# Altium project PI5_Robo_Board.PrjPcb
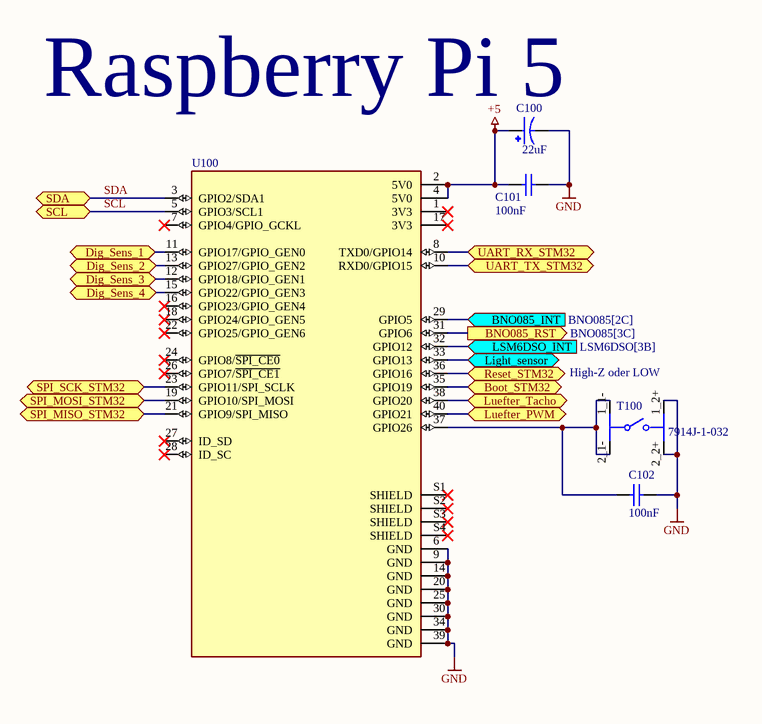
[diagram p0: Raspberry_PI5.SchDoc]
9 sheets, 219 parts. Net scope: flat (ports and power ports of the same name join across sheets).
Board file: PI5_Robo_Board_PCB.PcbDoc
Sheets:
  Raspberry_PI5.SchDoc
  BNO085.SchDoc
  LSM6DSO.SchDoc
  PCA9685.SchDoc
  DRV+Motor.SchDoc
  5V,_3V3,_6a,_Batt.SchDoc
  6b,_6c.SchDoc
  STM32.SchDoc
  Test_Sensor_Connectoren.SchDoc

## Sheet Raspberry_PI5.SchDoc
size A4; SheetNumber: 1; SheetTotal: 9

### Parts
C100  value 22uF  [CAP_EEEFN1A220R]  (hidden comment: ELKO)
C101  value 100nF  [0603]  (hidden comment: 0603)
C102  value 100nF  [0603]  (hidden comment: 0603)
T100  7914J-1-032  [FP-7914J-1-032-MFG]
U100  Raspberry Pi 5  [MODULE_SC0195(9)]  (value not drawn)

### Ports
BNO085_INT (in, see BNO085[2C]), BNO085_RST (out, see BNO085[3C]), Boot_STM32 (bidir, see STM32[2C]), Dig_Sens_1 (bidir, see Test_Sensor_Connectoren[1A]), Dig_Sens_2 (bidir, see Test_Sensor_Connectoren[1A]), Dig_Sens_3 (bidir, see Test_Sensor_Connectoren[1B]), Dig_Sens_4 (bidir, see Test_Sensor_Connectoren[1B]), Light_sensor (bidir, see Test_Sensor_Connectoren[1C]), LSM6DSO_INT (in, see LSM6DSO[3B]), Luefter_PWM (bidir, see Test_Sensor_Connectoren[2C]), Luefter_Tacho (bidir, see Test_Sensor_Connectoren[2C]), Reset_STM32 (bidir, see STM32[2C]), SCL (bidir, see BNO085[2C], LSM6DSO[2B], PCA9685[2B], Test_Sensor_Connectoren[1D], Test_Sensor_Connectoren[2D]), SDA (bidir, see BNO085[2C], LSM6DSO[2B], PCA9685[2B], Test_Sensor_Connectoren[1C], Test_Sensor_Connectoren[2D]), SPI_MISO_STM32 (bidir, see STM32[2B]), SPI_MOSI_STM32 (bidir, see STM32[2B]), SPI_SCK_STM32 (bidir, see STM32[1C]), UART_RX_STM32 (bidir, see STM32[1C]), UART_TX_STM32 (bidir, see STM32[1C])

### Nets
+5: C100.1 C101.2 U100.2(5V0) U100.4(5V0)
GND: C100.2 C101.1 C102.2 T100.1_2+(1_2+) T100.2_2+(2_2+) U100.6(GND) U100.9(GND) U100.14(GND) U100.20(GND) U100.25(GND) U100.30(GND) U100.34(GND) U100.39(GND)
SCL: U100.5(GPIO3/SCL1) ; port SCL
SDA: U100.3(GPIO2/SDA1) ; port SDA
NetC102_1: C102.1 T100.1_1-(1_1-) T100.2_1-(2_1-) U100.37(GPIO26)
NetDIG_Sens_1_2: U100.11(GPIO17/GPIO_GEN0) ; port Dig_Sens_1
NetDIG_Sens_2_2: U100.13(GPIO27/GPIO_GEN2) ; port Dig_Sens_2
NetDIG_Sens_3_2: U100.12(GPIO18/GPIO_GEN1) ; port Dig_Sens_3
NetDIG_Sens_4_2: U100.15(GPIO22/GPIO_GEN3) ; port Dig_Sens_4
NetLight_Sensor_2: U100.33(GPIO13) ; port Light_sensor
NetLuefter_2: U100.38(GPIO20) ; port Luefter_Tacho
NetLuefter_3: U100.40(GPIO21) ; port Luefter_PWM
NetR800_1: U100.36(GPIO16) ; port Reset_STM32
NetU100_8: U100.8(TXD0/GPIO14) ; port UART_RX_STM32
NetU100_10: U100.10(RXD0/GPIO15) ; port UART_TX_STM32
NetU100_19: U100.19(GPIO10/SPI_MOSI) ; port SPI_MOSI_STM32
NetU100_21: U100.21(GPIO9/SPI_MISO) ; port SPI_MISO_STM32
NetU100_23: U100.23(GPIO11/SPI_SCLK) ; port SPI_SCK_STM32
NetU100_29: U100.29(GPIO5) ; port BNO085_INT
NetU100_31: U100.31(GPIO6) ; port BNO085_RST
NetU100_32: U100.32(GPIO12) ; port LSM6DSO_INT
NetU100_35: U100.35(GPIO19) ; port Boot_STM32

Not connected (* = marked no-connect by the designer): U100 1(3V3)* 7(GPIO4/GPIO_GCKL)* 16(GPIO23/GPIO_GEN4)* 17(3V3)* 18(GPIO24/GPIO_GEN5)* 22(GPIO25/GPIO_GEN6)* 24(GPIO8/~{SPI_CE0})* 26(GPIO7/~{SPI_CE1})* 27(ID_SD)* 28(ID_SC)* S1(SHIELD)* S2(SHIELD)* S3(SHIELD)* S4(SHIELD)*

### Notes on the sheet
- (near C100) Raspberry Pi 5
- (near T100) High-Z oder LOW

### Library data of the parts
C100 = EEEFN1A220R: CAP ALUM 22UF 20% 10V SMD; MF: Panasonic; SnapEDA_Link: https://www.snapeda.com/parts/EEEFN1A220R/Panasonic/view-part/?ref=snap; Availability: In Stock; Purchase-URL: https://pricing.snapeda.com/search/part/EEEFN1A220R/?ref=eda; MP: EEEFN1A220R; Price: None; Package: RADIAL-2 Panasonic; Check_prices: https://www.snapeda.com/parts/EEEFN1A220R/Panasonic/view-part/?ref=eda
C101 C102 = KO: Kondensator
T100 = CMP-07427-000007-1: SWITCH TACTILE SPST-NO 0.1A 16V; Mechanical Life: 100000Cycles; Switch Function: Off-Mom; Actuator Material: Rubber; Illumination Type: Non-Illuminated; Actuator Type: Standard; Operating Force: 300gf; Throw Configuration: SPST; Current Rating: 100mA; Contact Plating: Silver; Min Operating Temperature: -55°C; Series: 7914; Package Quantity: 50; Max Operating Temperature: 125°C; Depth: 5mm; Termination: J-Hook; Mount: Surface Mount; RoHS Compliant: Yes; Case/Package: SMD/SMT; Voltage Rating (DC): 16V; Orientation: Straight; Max Current Rating: 100mA; Packaging: Rail/Tube; Length: 5mm; Contact Material: Gold
U100 = SC0195(9): The Raspberry Pi 5 Model B; SnapEDA_Link: https://www.snapeda.com/parts/SC0195(9)/Raspberry+Pi/view-part/?ref=snap; Package: None; Value: *; MF: Raspberry Pi; MP: SC0195(9); Check_prices: https://www.snapeda.com/parts/SC0195(9)/Raspberry+Pi/view-part/?ref=eda

## Sheet BNO085.SchDoc
size A4; SheetNumber: 2; SheetTotal: 9
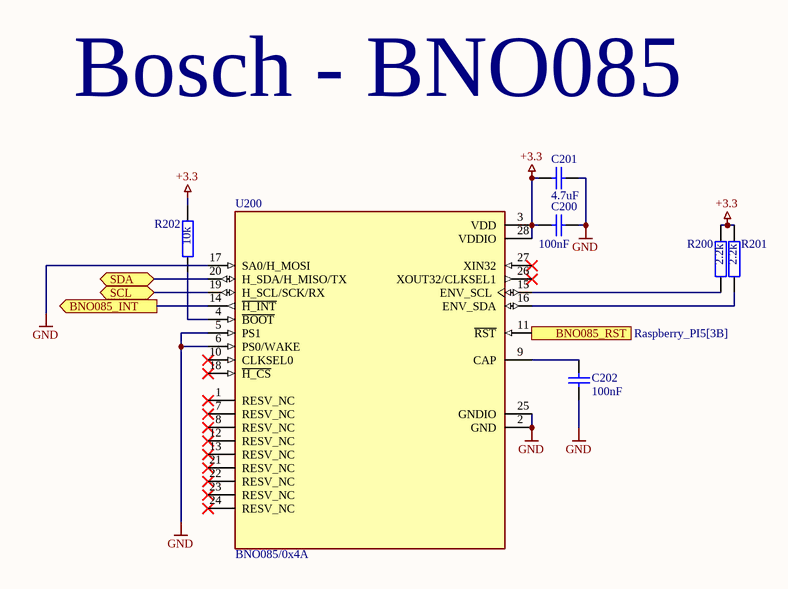
[diagram p1: BNO085.SchDoc]

### Parts
C200  value 100nF  [0603]  (hidden comment: 0603)
C201  value 4.7uF  [0603]  (hidden comment: 0603)
C202  value 100nF  [0603]  (hidden comment: 0603)
R200  value 2.2k  [0603]  (hidden comment: 0603)
R201  value 2.2k  [0603]  (hidden comment: 0603)
R202  value 10k  [0603]  (hidden comment: 0603)
U200  BNO085/0x4A  [IC_BNO085]

### Ports
BNO085_INT (out, see Raspberry_PI5[3B]), BNO085_RST (in, see Raspberry_PI5[3B]), SCL (bidir, see LSM6DSO[2B], PCA9685[2B], Raspberry_PI5[2B], Test_Sensor_Connectoren[1D], Test_Sensor_Connectoren[2D]), SDA (bidir, see LSM6DSO[2B], PCA9685[2B], Raspberry_PI5[2B], Test_Sensor_Connectoren[1C], Test_Sensor_Connectoren[2D])

### Nets
+3.3: C200.1 C201.1 R200.2 R201.2 R202.2 U200.3(VDD) U200.28(VDDIO)
GND: C200.2 C201.2 C202.2 U200.2(GND) U200.5(PS1) U200.6(PS0/WAKE) U200.17(SA0/H_MOSI) U200.25(GNDIO)
SCL: U200.19(H_SCL/SCK/RX) ; port SCL
SDA: U200.20(H_SDA/H_MISO/TX) ; port SDA
NetC202_1: C202.1 U200.9(CAP)
NetR200_1: R200.1 U200.15(ENV_SCL)
NetR201_1: R201.1 U200.16(ENV_SDA)
NetR202_1: R202.1 U200.4(~{BOOT})
NetU100_29: U200.14(~{H_INT}) ; port BNO085_INT
NetU100_31: U200.11(~{RST}) ; port BNO085_RST

Not connected (* = marked no-connect by the designer): U200 1(RESV_NC)* 7(RESV_NC)* 8(RESV_NC)* 10(CLKSEL0)* 12(RESV_NC)* 13(RESV_NC)* 18(~{H_CS})* 21(RESV_NC)* 22(RESV_NC)* 23(RESV_NC)* 24(RESV_NC)* 26(XOUT32/CLKSEL1)* 27(XIN32)*

### Notes on the sheet
- Bosch - BNO085

### Library data of the parts
C200-C202 = KO: Kondensator
R200-R202 = RES: Widerstand
U200 = BNO085: Accelerometer, Gyroscope, Magnetometer, 9 Axis Sensor IÂ²C, SPI, UART Output; MF: Hillcrest Laboratories,; SnapEDA_Link: https://www.snapeda.com/parts/BNO085/Hillcrest+Laboratories%252C+Inc./view-part/?ref=snap; Package: TFLGA-28 Hillcrest Laboratories; Value: *; MP: BNO085; Check_prices: https://www.snapeda.com/parts/BNO085/Hillcrest+Laboratories%252C+Inc./view-part/?ref=eda

## Sheet LSM6DSO.SchDoc
size A4; SheetNumber: 3; SheetTotal: 9
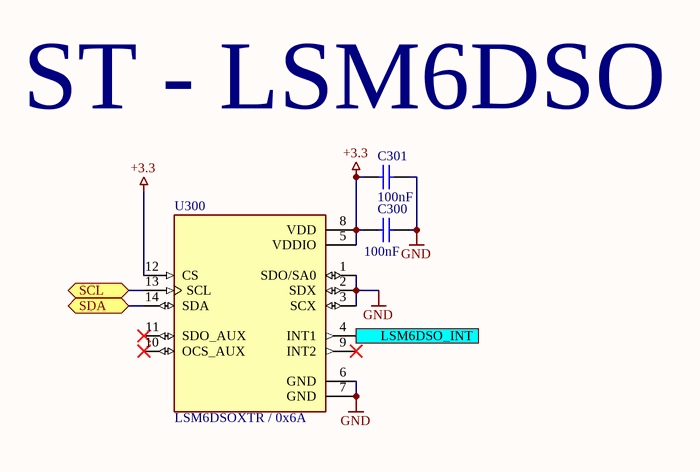
[diagram p2: LSM6DSO.SchDoc]

### Parts
C300  value 100nF  [0603]  (hidden comment: 0603)
C301  value 100nF  [0603]  (hidden comment: 0603)
U300  LSM6DSOXTR / 0x6A  [PQFN50P250X300X86-14N]

### Ports
LSM6DSO_INT (out, see Raspberry_PI5[3B]), SCL (bidir, see BNO085[2C], PCA9685[2B], Raspberry_PI5[2B], Test_Sensor_Connectoren[1D], Test_Sensor_Connectoren[2D]), SDA (bidir, see BNO085[2C], PCA9685[2B], Raspberry_PI5[2B], Test_Sensor_Connectoren[1C], Test_Sensor_Connectoren[2D])

### Nets
+3.3: C300.1 C301.1 U300.5(VDDIO) U300.8(VDD) U300.12(CS)
GND: C300.2 C301.2 U300.1(SDO/SA0) U300.2(SDX) U300.3(SCX) U300.6(GND) U300.7(GND)
SCL: U300.13(SCL) ; port SCL
SDA: U300.14(SDA) ; port SDA
NetU100_32: U300.4(INT1) ; port LSM6DSO_INT

Not connected (* = marked no-connect by the designer): U300 9(INT2)* 10(OCS_AUX)* 11(SDO_AUX)*

### Notes on the sheet
- (near C301) ST - LSM6DSO

### Library data of the parts
C300 C301 = KO: Kondensator
U300 = LSM6DSOXTR: Accelerometer, Gyroscope, 6 Axis Sensor I2C, SPI Output; MF: STMicroelectronics; SnapEDA_Link: https://www.snapeda.com/parts/LSM6DSOXTR/STMicroelectronics/view-part/?ref=snap; Package: VFLGA-14 STMicroelectronics; Value: *; MP: LSM6DSOXTR; Check_prices: https://www.snapeda.com/parts/LSM6DSOXTR/STMicroelectronics/view-part/?ref=eda

## Sheet PCA9685.SchDoc
size A4; SheetNumber: 4; SheetTotal: 9
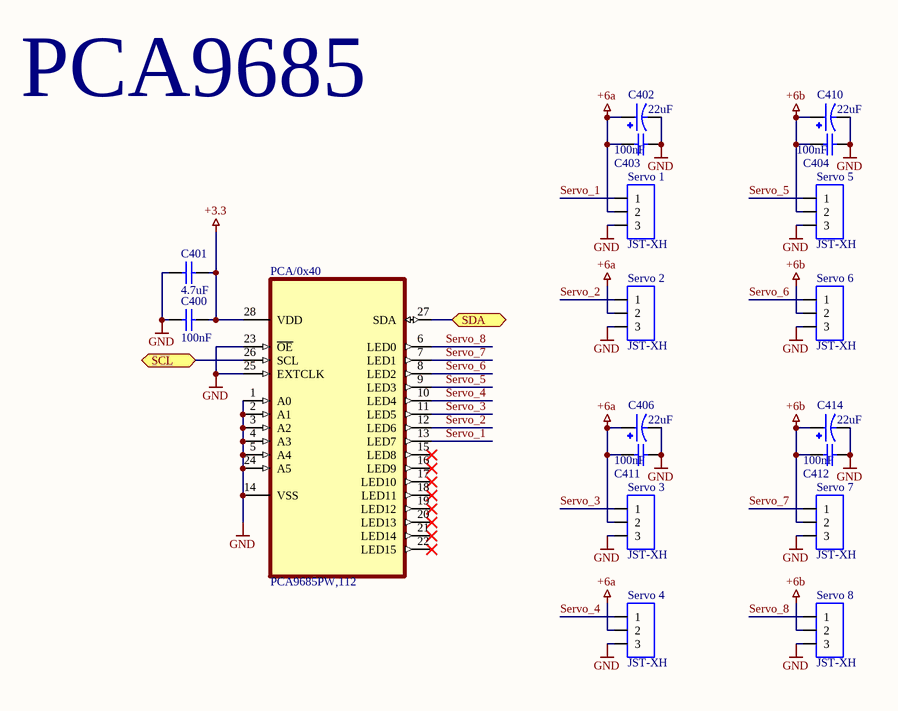
[diagram p3: PCA9685.SchDoc]

### Parts
C400  value 100nF  [0603]  (hidden comment: 0603)
C401  value 4.7uF  [0603]  (hidden comment: 0603)
C402  value 22uF  [CAP_EEEFN1A220R]  (hidden comment: ELKO)
C403  value 100nF  [0603]  (hidden comment: 0603)
C404  value 100nF  [0603]  (hidden comment: 0603)
C406  value 22uF  [CAP_EEEFN1A220R]  (hidden comment: ELKO)
C410  value 22uF  [CAP_EEEFN1A220R]  (hidden comment: ELKO)
C411  value 100nF  [0603]  (hidden comment: 0603)
C412  value 100nF  [0603]  (hidden comment: 0603)
C414  value 22uF  [CAP_EEEFN1A220R]  (hidden comment: ELKO)
PCA/0x40  PCA9685PW,112  [SOP65P640X110-28N]
Servo_1  JST-XH  [Sip-3]
Servo_2  JST-XH  [Sip-3]
Servo_3  JST-XH  [Sip-3]
Servo_4  JST-XH  [Sip-3]
Servo_5  JST-XH  [Sip-3]
Servo_6  JST-XH  [Sip-3]
Servo_7  JST-XH  [Sip-3]
Servo_8  JST-XH  [Sip-3]

### Ports
SCL (bidir, see BNO085[2C], LSM6DSO[2B], Raspberry_PI5[2B], Test_Sensor_Connectoren[1D], Test_Sensor_Connectoren[2D]), SDA (bidir, see BNO085[2C], LSM6DSO[2B], Raspberry_PI5[2B], Test_Sensor_Connectoren[1C], Test_Sensor_Connectoren[2D])

### Nets
+3.3: C400.2 C401.2 PCA/0x40.28(VDD)
+6a: C402.1 C403.2 C406.1 C411.2 Servo_1.2 Servo_2.2 Servo_3.2 Servo_4.2
+6b: C404.2 C410.1 C412.2 C414.1 Servo_5.2 Servo_6.2 Servo_7.2 Servo_8.2
GND: C400.1 C401.1 C402.2 C403.1 C404.1 C406.2 C410.2 C411.1 C412.1 C414.2 PCA/0x40.1(A0) PCA/0x40.2(A1) PCA/0x40.3(A2) PCA/0x40.4(A3) PCA/0x40.5(A4) PCA/0x40.14(VSS) PCA/0x40.23(~{OE}) PCA/0x40.24(A5) PCA/0x40.25(EXTCLK) Servo_1.3 Servo_2.3 Servo_3.3 Servo_4.3 Servo_5.3 Servo_6.3 Servo_7.3 Servo_8.3
SCL: PCA/0x40.26(SCL) ; port SCL
SDA: PCA/0x40.27(SDA) ; port SDA
Servo_1: PCA/0x40.13(LED7) Servo_1.1
Servo_2: PCA/0x40.12(LED6) Servo_2.1
Servo_3: PCA/0x40.11(LED5) Servo_3.1
Servo_4: PCA/0x40.10(LED4) Servo_4.1
Servo_5: PCA/0x40.9(LED3) Servo_5.1
Servo_6: PCA/0x40.8(LED2) Servo_6.1
Servo_7: PCA/0x40.7(LED1) Servo_7.1
Servo_8: PCA/0x40.6(LED0) Servo_8.1

Not connected (* = marked no-connect by the designer): PCA/0x40 15(LED8)* 16(LED9)* 17(LED10)* 18(LED11)* 19(LED12)* 20(LED13)* 21(LED14)* 22(LED15)*

### Notes on the sheet
- PCA9685

### Library data of the parts
C400 C401 C403 C404 C411 C412 = KO: Kondensator
C402 C406 C410 C414 = EEEFN1A220R: CAP ALUM 22UF 20% 10V SMD; MF: Panasonic; SnapEDA_Link: https://www.snapeda.com/parts/EEEFN1A220R/Panasonic/view-part/?ref=snap; Availability: In Stock; Purchase-URL: https://pricing.snapeda.com/search/part/EEEFN1A220R/?ref=eda; MP: EEEFN1A220R; Price: None; Package: RADIAL-2 Panasonic; Check_prices: https://www.snapeda.com/parts/EEEFN1A220R/Panasonic/view-part/?ref=eda
PCA/0x40 = PCA9685PW,112: LED Driver IC 16 Output Linear - PWM Dimming 25mA 28-TSSOP; MF: NXP USA; SnapEDA_Link: https://www.snapeda.com/parts/PCA9685PW,112/NXP+Semiconductors/view-part/?ref=snap; Package: TSSOP-28 NXP Semiconductors; Value: *; MP: PCA9685PW,112; Check_prices: https://www.snapeda.com/parts/PCA9685PW,112/NXP+Semiconductors/view-part/?ref=eda
Servo_1-Servo_8 = CON3

## Sheet DRV+Motor.SchDoc
size A4; SheetNumber: 5; SheetTotal: 9
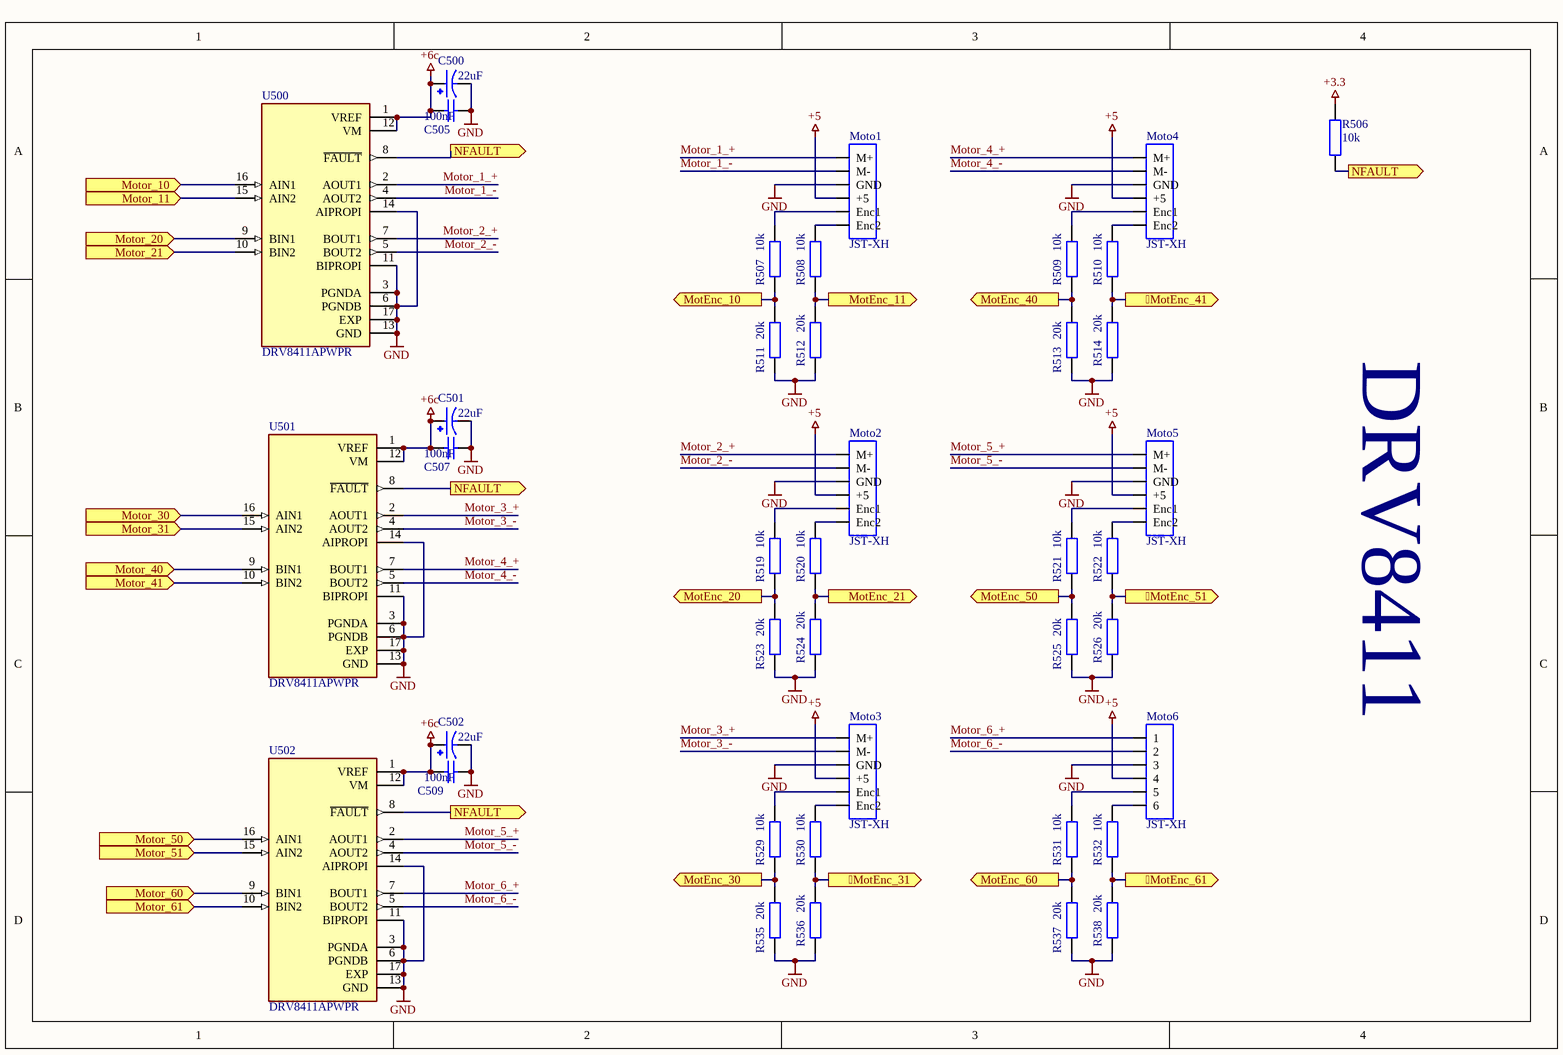
[diagram p4: DRV+Motor.SchDoc]

### Parts
C500  value 22uF  [CAP_EEEFN1A220R]  (hidden comment: ELKO)
C501  value 22uF  [CAP_EEEFN1A220R]  (hidden comment: ELKO)
C502  value 22uF  [CAP_EEEFN1A220R]  (hidden comment: ELKO)
C505  value 100nF  [0603]  (hidden comment: 0603)
C507  value 100nF  [0603]  (hidden comment: 0603)
C509  value 100nF  [0603]  (hidden comment: 0603)
Moto1  JST-XH  [SIP-6]
Moto2  JST-XH  [SIP-6]
Moto3  JST-XH  [SIP-6]
Moto4  JST-XH  [SIP-6]
Moto5  JST-XH  [SIP-6]
Moto6  JST-XH  [SIP-6]
R506  value 10k  [0603]  (hidden comment: 0603)
R507  value 10k  [0603]  (hidden comment: 0603)
R508  value 10k  [0603]  (hidden comment: 0603)
R509  value 10k  [0603]  (hidden comment: 0603)
R510  value 10k  [0603]  (hidden comment: 0603)
R511  value 20k  [0603]  (hidden comment: 0603)
R512  value 20k  [0603]  (hidden comment: 0603)
R513  value 20k  [0603]  (hidden comment: 0603)
R514  value 20k  [0603]  (hidden comment: 0603)
R519  value 10k  [0603]  (hidden comment: 0603)
R520  value 10k  [0603]  (hidden comment: 0603)
R521  value 10k  [0603]  (hidden comment: 0603)
R522  value 10k  [0603]  (hidden comment: 0603)
R523  value 20k  [0603]  (hidden comment: 0603)
R524  value 20k  [0603]  (hidden comment: 0603)
R525  value 20k  [0603]  (hidden comment: 0603)
R526  value 20k  [0603]  (hidden comment: 0603)
R529  value 10k  [0603]  (hidden comment: 0603)
R530  value 10k  [0603]  (hidden comment: 0603)
R531  value 10k  [0603]  (hidden comment: 0603)
R532  value 10k  [0603]  (hidden comment: 0603)
R535  value 20k  [0603]  (hidden comment: 0603)
R536  value 20k  [0603]  (hidden comment: 0603)
R537  value 20k  [0603]  (hidden comment: 0603)
R538  value 20k  [0603]  (hidden comment: 0603)
U500  DRV8411APWPR  [IC_DRV8411APWPR]
U501  DRV8411APWPR  [IC_DRV8411APWPR]
U502  DRV8411APWPR  [IC_DRV8411APWPR]

### Ports
MotEnc_31 (out, see STM32[1C]), MotEnc_41 (out, see STM32[1C]), MotEnc_51 (out, see STM32[2C]), MotEnc_61 (out, see STM32[2B]), MotEnc_10 (out, see STM32[2B]), MotEnc_11 (out, see STM32[2B]), MotEnc_20 (out, see STM32[2B]), MotEnc_21 (out, see STM32[1C]), MotEnc_30 (out, see STM32[1C]), MotEnc_40 (out, see STM32[1C]), MotEnc_50 (out, see STM32[2B]), MotEnc_60 (out, see STM32[2B]), Motor_10 (in, see STM32[1C]), Motor_11 (in, see STM32[1B]), Motor_20 (in, see STM32[1B]), Motor_21 (in, see STM32[1B]), Motor_30 (in, see STM32[1B]), Motor_31 (in, see STM32[2B]), Motor_40 (in, see STM32[2B]), Motor_41 (in, see STM32[2B]), Motor_50 (in, see STM32[2B]), Motor_51 (in, see STM32[1B]), Motor_60 (in, see STM32[1B]), Motor_61 (in, see STM32[1B]), NFAULT (out, see DRV+Motor[2A], DRV+Motor[2B], DRV+Motor[2D], STM32[1C]), NFAULT (out, see DRV+Motor[2A], DRV+Motor[2B], DRV+Motor[4A], STM32[1C]), NFAULT (out, see DRV+Motor[2A], DRV+Motor[2D], DRV+Motor[4A], STM32[1C]), NFAULT (out, see DRV+Motor[2B], DRV+Motor[2D], DRV+Motor[4A], STM32[1C])

### Nets
+3.3: R506.2
+5: Moto1.4(+5) Moto2.4(+5) Moto3.4(+5) Moto4.4(+5) Moto5.4(+5) Moto6.4
+6c: C500.1 C501.1 C502.1 C505.2 C507.2 C509.2 U500.1(VREF) U500.12(VM) U501.1(VREF) U501.12(VM) U502.1(VREF) U502.12(VM)
GND: C500.2 C501.2 C502.2 C505.1 C507.1 C509.1 Moto1.3(GND) Moto2.3(GND) Moto3.3(GND) Moto4.3(GND) Moto5.3(GND) Moto6.3 R511.1 R512.1 R513.1 R514.1 R523.1 R524.1 R525.1 R526.1 R535.1 R536.1 R537.1 R538.1 U500.3(PGNDA) U500.6(PGNDB) U500.11(BIPROPI) U500.13(GND) U500.14(AIPROPI) U500.17(EXP) U501.3(PGNDA) U501.6(PGNDB) U501.11(BIPROPI) U501.13(GND) U501.14(AIPROPI) U501.17(EXP) U502.3(PGNDA) U502.6(PGNDB) U502.11(BIPROPI) U502.13(GND) U502.14(AIPROPI) U502.17(EXP)
Motor_1_+: Moto1.1(M+) U500.2(AOUT1)
Motor_1_-: Moto1.2(M-) U500.4(AOUT2)
Motor_2_+: Moto2.1(M+) U500.7(BOUT1)
Motor_2_-: Moto2.2(M-) U500.5(BOUT2)
Motor_3_+: Moto3.1(M+) U501.2(AOUT1)
Motor_3_-: Moto3.2(M-) U501.4(AOUT2)
Motor_4_+: Moto4.1(M+) U501.7(BOUT1)
Motor_4_-: Moto4.2(M-) U501.5(BOUT2)
Motor_5_+: Moto5.1(M+) U502.2(AOUT1)
Motor_5_-: Moto5.2(M-) U502.4(AOUT2)
Motor_6_+: Moto6.1 U502.7(BOUT1)
Motor_6_-: Moto6.2 U502.5(BOUT2)
NetMoto1_5: Moto1.5(Enc1) R507.1
NetMoto1_6: Moto1.6(Enc2) R508.1
NetMoto2_5: Moto2.5(Enc1) R519.1
NetMoto2_6: Moto2.6(Enc2) R520.1
NetMoto3_5: Moto3.5(Enc1) R529.1
NetMoto3_6: Moto3.6(Enc2) R530.1
NetMoto4_5: Moto4.5(Enc1) R509.1
NetMoto4_6: Moto4.6(Enc2) R510.1
NetMoto5_5: Moto5.5(Enc1) R521.1
NetMoto5_6: Moto5.6(Enc2) R522.1
NetMoto6_5: Moto6.5 R531.1
NetMoto6_6: Moto6.6 R532.1
NetR506_1: R506.1 U500.8(~{FAULT}) U501.8(~{FAULT}) U502.8(~{FAULT}) ; port NFAULT
NetR507_2: R507.2 R511.2 ; port MotEnc_10
NetR508_2: R508.2 R512.2 ; port MotEnc_11
NetR509_2: R509.2 R513.2 ; port MotEnc_40
NetR510_2: R510.2 R514.2 ; port MotEnc_41
NetR519_2: R519.2 R523.2 ; port MotEnc_20
NetR520_2: R520.2 R524.2 ; port MotEnc_21
NetR521_2: R521.2 R525.2 ; port MotEnc_50
NetR522_2: R522.2 R526.2 ; port MotEnc_51
NetR529_2: R529.2 R535.2 ; port MotEnc_30
NetR530_2: R530.2 R536.2 ; port MotEnc_31
NetR531_2: R531.2 R537.2 ; port MotEnc_60
NetR532_2: R532.2 R538.2 ; port MotEnc_61
NetU500_9: U500.9(BIN1) ; port Motor_20
NetU500_10: U500.10(BIN2) ; port Motor_21
NetU500_15: U500.15(AIN2) ; port Motor_11
NetU500_16: U500.16(AIN1) ; port Motor_10
NetU501_9: U501.9(BIN1) ; port Motor_40
NetU501_10: U501.10(BIN2) ; port Motor_41
NetU501_15: U501.15(AIN2) ; port Motor_31
NetU501_16: U501.16(AIN1) ; port Motor_30
NetU502_9: U502.9(BIN1) ; port Motor_60
NetU502_10: U502.10(BIN2) ; port Motor_61
NetU502_15: U502.15(AIN2) ; port Motor_51
NetU502_16: U502.16(AIN1) ; port Motor_50

### Notes on the sheet
- DRV8411

### Library data of the parts
C500-C502 = EEEFN1A220R: CAP ALUM 22UF 20% 10V SMD; MF: Panasonic; SnapEDA_Link: https://www.snapeda.com/parts/EEEFN1A220R/Panasonic/view-part/?ref=snap; Availability: In Stock; Purchase-URL: https://pricing.snapeda.com/search/part/EEEFN1A220R/?ref=eda; MP: EEEFN1A220R; Price: None; Package: RADIAL-2 Panasonic; Check_prices: https://www.snapeda.com/parts/EEEFN1A220R/Panasonic/view-part/?ref=eda
C505 C507 C509 = KO: Kondensator
Moto1-Moto6 = CON6
R506-R514 R519-R526 R529-R532 R535-R538 = RES: Widerstand
U500-U502 = DRV8411APWPR: 1.65-V to 11-V, 4-A dual H-bridge motor driver with IPROPI current regulation; MF: Texas Instruments; SnapEDA_Link: https://www.snapeda.com/parts/DRV8411APWPR/Texas+Instruments/view-part/?ref=snap; Package: TSSOP-16 Texas Instruments; Value: *; MP: DRV8411APWPR; Check_prices: https://www.snapeda.com/parts/DRV8411APWPR/Texas+Instruments/view-part/?ref=eda

## Sheet 5V,_3V3,_6a,_Batt.SchDoc
size A4; SheetNumber: 6; SheetTotal: 9
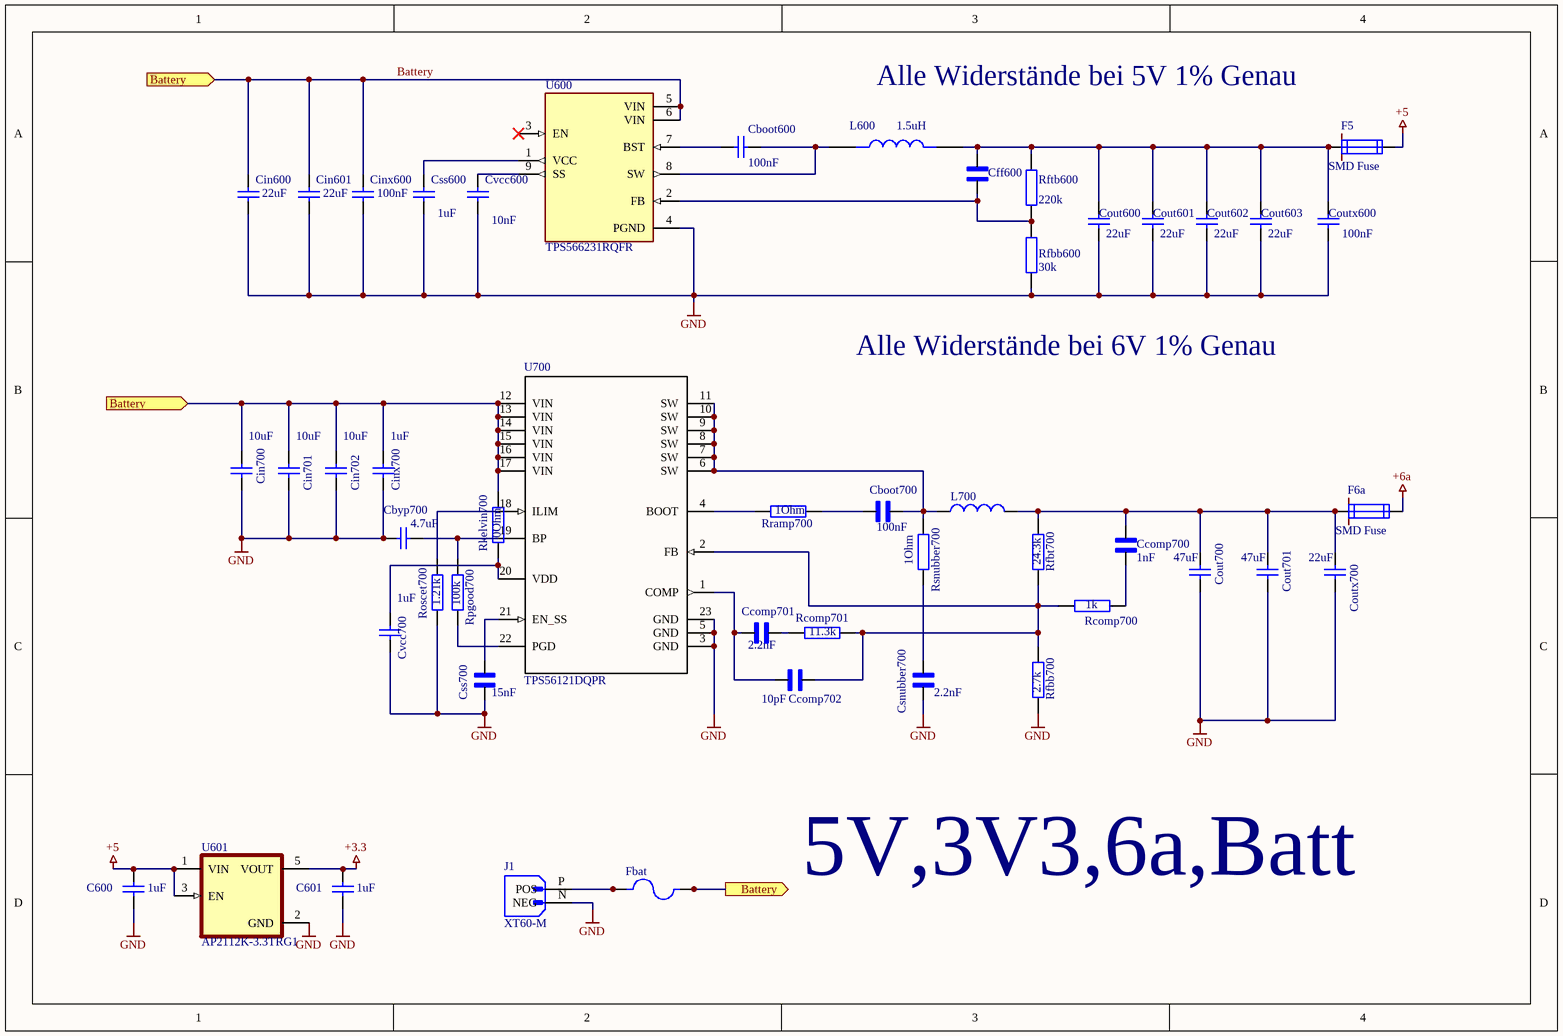
[diagram p5: 5V,_3V3,_6a,_Batt.SchDoc]

### Parts
C600  value 1uF  [0603]  (hidden comment: 0603)
C601  value 1uF  [0603]  (hidden comment: 0603)
Cboot600  value 100nF  [0603]  (hidden comment: 1% 0603)
Cboot700  value 100nF  [CAPC1005X61N]  (hidden comment: 1% 0402)
Cbyp700  value 4.7uF  [0603]  (hidden comment: 1% 0603)
Ccomp700  value 1nF  [CAPC1005X61N]  (hidden comment: 1% 0402)
Ccomp701  value 2.2nF  [CAPC1005X61N]  (hidden comment: 1% 0402)
Ccomp702  value 10pF  [CAPC1005X61N]  (hidden comment: 1% 0402)
Cff600  1% 0402  [CAPC1005X61N]  (value not drawn)
Cin600  value 22uF  [0603]  (hidden comment: 1% 0603)
Cin601  value 22uF  [0603]  (hidden comment: 1% 0603)
Cin700  value 10uF  [0603]  (hidden comment: 1% 0603)
Cin701  value 10uF  [0603]  (hidden comment: 1% 0603)
Cin702  value 10uF  [0603]  (hidden comment: 1% 0603)
Cinx600  value 100nF  [0603]  (hidden comment: 1% 0603)
Cinx700  value 1uF  [0603]  (hidden comment: 1% 0603)
Cout600  value 22uF  [0603]  (hidden comment: 1% 0603)
Cout601  value 22uF  [0603]  (hidden comment: 1% 0603)
Cout602  value 22uF  [0603]  (hidden comment: 1% 0603)
Cout603  value 22uF  [0603]  (hidden comment: 1% 0603)
Cout700  value 47uF  [0603]  (hidden comment: 1% 0603)
Cout701  value 47uF  [0603]  (hidden comment: 1% 0603)
Coutx600  value 100nF  [0603]  (hidden comment: 1% 0603)
Coutx700  value 22uF  [0603]  (hidden comment: 1% 0603)
Csnubber700  value 2.2nF  [CAPC1005X61N]  (hidden comment: 1% 0402)
Css600  value 1uF  [0603]  (hidden comment: 1% 0603)
Css700  value 15nF  [CAPC1005X61N]  (hidden comment: 1% 0402)
Cvcc600  value 10nF  [0603]  (hidden comment: 1% 0603)
Cvcc700  value 1uF  [0603]  (hidden comment: 1% 0603)
F5  SMD Fuse  [1206]
F6a  SMD Fuse  [1206]
Fbat  3557-15  [FUSE_3557-15]  (value not drawn)
J1  XT60-M  [AMASS_XT60-M]
L600  value 1.5uH  [IND_SPM6530T-1R5M100]  (hidden comment: Spule)
L700  (no value)  [WE-HCC_807021]
Rcomp700  value 1k  [0603]  (hidden comment: 1% 0603)
Rcomp701  value 11.3k  [0603]  (hidden comment: 1% 0603)
Rfbb600  value 30k  [0603]  (hidden comment: 1% 0603)
Rfbb700  value 2.7k  [0603]  (hidden comment: 1% 0603)
Rfbt700  value 24.3k  [0603]  (hidden comment: 1% 0603)
Rftb600  value 220k  [0603]  (hidden comment: 1% 0603)
Rkelvin700  value 0Ohm  [0603]  (hidden comment: 1% 0603)
Roscet700  value 1.21k  [0603]  (hidden comment: 1% 0603)
Rpgood700  value 100k  [0603]  (hidden comment: 1% 0603)
Rramp700  value 1Ohm  [0603]  (hidden comment: 1% 0603)
Rsnubber700  value 1Ohm  [0603]  (hidden comment: 1% 0603)
U600  TPS566231RQFR  [IC_TPS566231RQFR]
U601  AP2112K-3.3TRG1  [SOT95P285X140-5N]
U700  TPS56121DQPR  [DQP0022A]

### Ports
Battery (in, see 5V,_3V3,_6a,_Batt[1A], 5V,_3V3,_6a,_Batt[2D], 6b,_6c[1A], 6b,_6c[1C], Test_Sensor_Connectoren[2C]), Battery (in, see 5V,_3V3,_6a,_Batt[1B], 5V,_3V3,_6a,_Batt[2D], 6b,_6c[1A], 6b,_6c[1C], Test_Sensor_Connectoren[2C]), Battery (out, see 5V,_3V3,_6a,_Batt[1A], 5V,_3V3,_6a,_Batt[1B], 6b,_6c[1A], 6b,_6c[1C], Test_Sensor_Connectoren[2C])

### Nets
+3.3: C601.2 U601.5(VOUT)
+5: C600.2 F5.2 U601.1(VIN) U601.3(EN)
+6a: F6a.2
GND: C600.1 C601.1 Cbyp700.2 Cin600.1 Cin601.1 Cin700.2 Cin701.2 Cin702.2 Cinx600.1 Cinx700.2 Cout600.2 Cout601.2 Cout602.2 Cout603.2 Cout700.2 Cout701.2 Coutx600.2 Coutx700.2 Csnubber700.1 Css600.2 Css700.1 Cvcc600.2 Cvcc700.2 J1.N(NEG) Rfbb600.1 Rfbb700.1 Roscet700.2 U600.4(PGND) U601.2(GND) U700.3(GND) U700.5(GND) U700.23(GND)
Battery: Cin600.2 Cin601.2 Cin700.1 Cin701.1 Cin702.1 Cinx600.2 Cinx700.1 Fbat.2_1 Fbat.2_2 Rkelvin700.2 U600.5(VIN) U600.6(VIN) U700.12(VIN) U700.13(VIN) U700.14(VIN) U700.15(VIN) U700.16(VIN) U700.17(VIN) ; port Battery
NetCboot600_1: Cboot600.1 U600.7(BST)
NetCboot600_2: Cboot600.2 L600.1 U600.8(SW)
NetCboot700_1: Cboot700.1 L700.1 Rsnubber700.2 U700.6(SW) U700.7(SW) U700.8(SW) U700.9(SW) U700.10(SW) U700.11(SW)
NetCboot700_2: Cboot700.2 Rramp700.2
NetCbyp700_1: Cbyp700.1 Rpgood700.1 U700.19(BP)
NetCcomp700_1: Ccomp700.1 Rcomp700.1
NetCcomp700_2: Ccomp700.2 Cout700.1 Cout701.1 Coutx700.1 F6a.1 L700.2 Rfbt700.2
NetCcomp701_1: Ccomp701.1 Ccomp702.1 U700.1(COMP)
NetCcomp701_2: Ccomp701.2 Rcomp701.1
NetCcomp702_2: Ccomp702.2 Rcomp700.2 Rcomp701.2 Rfbb700.2 Rfbt700.1 U700.2(FB)
NetCff600_1: Cff600.1 Cout600.1 Cout601.1 Cout602.1 Cout603.1 Coutx600.1 F5.1 L600.2 Rftb600.2
NetCff600_2: Cff600.2 Rfbb600.2 Rftb600.1 U600.2(FB)
NetCsnubber700_2: Csnubber700.2 Rsnubber700.1
NetCss600_1: Css600.1 U600.1(VCC)
NetCss700_2: Css700.2 U700.21(EN_SS)
NetCvcc600_1: Cvcc600.1 U600.9(SS)
NetCvcc700_1: Cvcc700.1 Rkelvin700.1 U700.20(VDD)
NetFbat_1_1: Fbat.1_1 Fbat.1_2 J1.P(POS)
NetRoscet700_1: Roscet700.1 U700.18(ILIM)
NetRpgood700_2: Rpgood700.2 U700.22(PGD)
NetRramp700_1: Rramp700.1 U700.4(BOOT)

Not connected (* = marked no-connect by the designer): U600 3(EN)*

### Notes on the sheet
- Alle Widerstände bei 5V 1% Genau
- Alle Widerstände bei 6V 1% Genau
- 5V,3V3,6a,Batt

### Library data of the parts
C600 C601 Cboot600 Cbyp700 Cin600 Cin601 Cin700-Cin702 Cinx600 Cinx700 Cout600-Cout603 Cout700 Cout701 Coutx600 Coutx700 Css600 Cvcc600 Cvcc700 = KO: Kondensator
Cboot700 Ccomp700-Ccomp702 Csnubber700 Css700 = VJ0402D100KXCAP: Kondensator; Package: None; Price: None; MP: VJ0402D100KXCAP; Availability: Unavailable
Cff600 = VJ0402D100KXCAP: Kondensator; Value: 33pF; Package: None; Price: None; MP: VJ0402D100KXCAP; Availability: Unavailable
F5 = SICHERUNG: SMD Fuse / Voltage rating >6V / Current 7.5A / 1206; Text Field1: Strom
F6a = SICHERUNG: SMD Fuse / Voltage rating >6V / Current 12,5A / 1206; Text Field1: Strom
Fbat = 3557-15: Auto Fuse Holder; THM; Insulated Clip; 30 Amp; Blue | Keystone Electronics 3557-15; SnapEDA_Link: https://www.snapeda.com/parts/3557-15/Keystone/view-part/?ref=snap; Package: None; Value: *; MF: Keystone Electronics; MP: 3557-15; Check_prices: https://www.snapeda.com/parts/3557-15/Keystone/view-part/?ref=eda
J1 = XT60-M: Plug; DC supply; XT60; male; PIN: 2; for cable; soldered; 30A; 500V; MF: AMASS; SnapEDA_Link: https://www.snapeda.com/parts/XT60-M/AMASS/view-part/?ref=snap; Package: Package; Value: *; MP: XT60-M; Check_prices: https://www.snapeda.com/parts/XT60-M/AMASS/view-part/?ref=eda
L600 = SPM6530T-1R5M100: 1.5µH Shielded Drum Core, Wirewound Inductor 11 A 10.67mOhm Max Nonstandard; MF: TDK; Digi-Key_Part_Number: 445-3881-2-ND; Check_prices: https://www.snapeda.com/parts/SPM6530T-1R5M100/TDK/view-part/?ref=eda; Package: NON STANDARD-2 TDK; SnapEDA_Link: https://www.snapeda.com/parts/SPM6530T-1R5M100/TDK/view-part/?ref=snap; MP: SPM6530T-1R5M100; Purchase-URL: https://pricing.snapeda.com/search/part/SPM6530T-1R5M100/?ref=eda
L700 = 7443340220: 7443340220 - Würth; Manufacturer_Name: Wurth Elektronik; Datasheet Link: https://www.we-online.com/components/products/download/3D_WE-HCC-8070_7443340xxx_3D+%28rev1%29.pdf; Height: 7.2mm; Manufacturer_Part_Number: 7443340220; Mouser Part Number: 710-7443340220; Mouser Price/Stock: https://www.mouser.co.uk/ProductDetail/Wurth-Elektronik/7443340220?qs=MVRUG6Lt7nGtb48EAN9JeA%3D%3D
Rcomp700 Rcomp701 Rfbb600 Rfbb700 Rfbt700 Rftb600 Rkelvin700 Roscet700 Rpgood700 Rramp700 Rsnubber700 = RES: Widerstand
U600 = TPS566231RQFR: Wandler IC; MF: {'manufacturer': u'Texas Instruments'}; Package: None; Price: None; Value: *; MP: TPS566231RQFR; Availability: Unavailable
U601 = AP2112K-3.3TRG1: Linear Voltage Regulator IC Positive Fixed 1 Output 600mA SOT-25; MF: Diodes Inc.; Value: *; Purchase-URL: https://pricing.snapeda.com/search/part/AP2112K-3.3TRG1/?ref=eda; Package: SOT-753 Diodes Inc.; Availability: In Stock; Check_prices: https://www.snapeda.com/parts/AP2112K-3.3TRG1/Diodes+Inc./view-part/?ref=eda; Price: None; SnapEDA_Link: https://www.snapeda.com/parts/AP2112K-3.3TRG1/Diodes+Inc./view-part/?ref=snap; MP: AP2112K-3.3TRG1
U700 = TPS56121DQPR: Wandler IC; Manufacturer: Texas Instruments; PartNumber: TPS56121DQPR; RefDes: RefDes; TYPE: TYPE; Manufacturer_Part_Number: TPS56121DQPR; Manufacturer_Name: Texas Instruments; Copyright: Copyright (C) 2018 Accelerated Designs. All rights reserved

## Sheet 6b,_6c.SchDoc
size A4; SheetNumber: 7; SheetTotal: 9
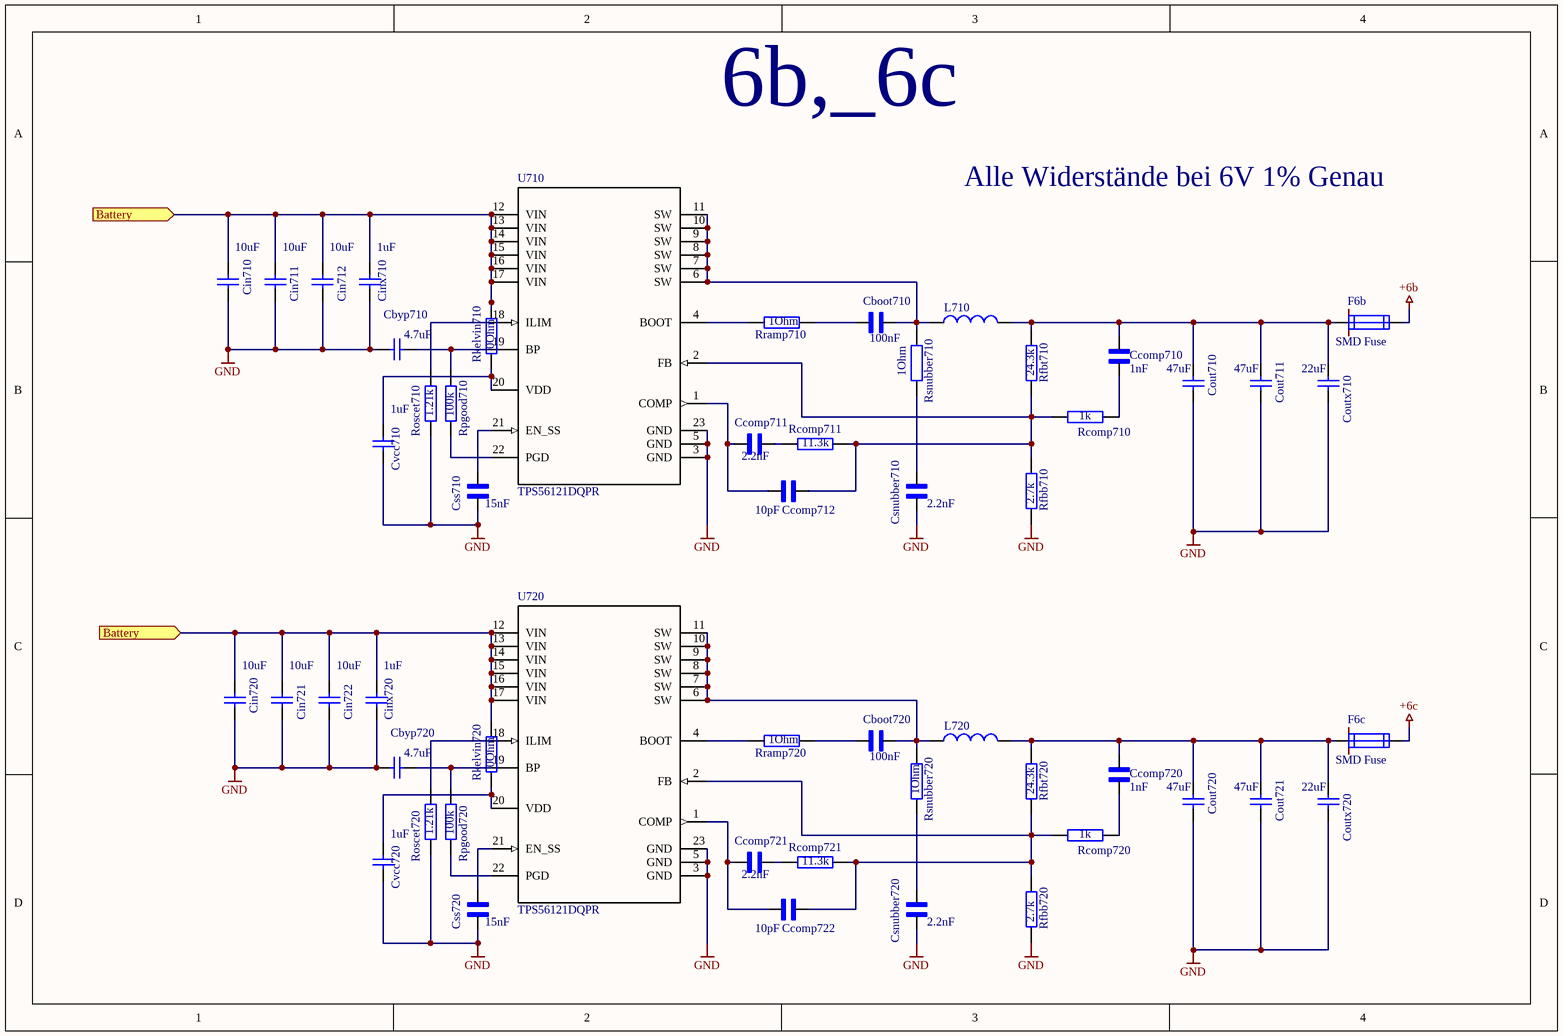
[diagram p6: 6b,_6c.SchDoc]

### Parts
Cboot710  value 100nF  [CAPC1005X61N]  (hidden comment: 1% 0402)
Cboot720  value 100nF  [CAPC1005X61N]  (hidden comment: 1% 0402)
Cbyp710  value 4.7uF  [0603]  (hidden comment: 1% 0603)
Cbyp720  value 4.7uF  [0603]  (hidden comment: 1% 0603)
Ccomp710  value 1nF  [CAPC1005X61N]  (hidden comment: 1% 0402)
Ccomp711  value 2.2nF  [CAPC1005X61N]  (hidden comment: 1% 0402)
Ccomp712  value 10pF  [CAPC1005X61N]  (hidden comment: 1% 0402)
Ccomp720  value 1nF  [CAPC1005X61N]  (hidden comment: 1% 0402)
Ccomp721  value 2.2nF  [CAPC1005X61N]  (hidden comment: 1% 0402)
Ccomp722  value 10pF  [CAPC1005X61N]  (hidden comment: 1% 0402)
Cin710  value 10uF  [0603]  (hidden comment: 1% 0603)
Cin711  value 10uF  [0603]  (hidden comment: 1% 0603)
Cin712  value 10uF  [0603]  (hidden comment: 1% 0603)
Cin720  value 10uF  [0603]  (hidden comment: 1% 0603)
Cin721  value 10uF  [0603]  (hidden comment: 1% 0603)
Cin722  value 10uF  [0603]  (hidden comment: 1% 0603)
Cinx710  value 1uF  [0603]  (hidden comment: 1% 0603)
Cinx720  value 1uF  [0603]  (hidden comment: 1% 0603)
Cout710  value 47uF  [0603]  (hidden comment: 1% 0603)
Cout711  value 47uF  [0603]  (hidden comment: 1% 0603)
Cout720  value 47uF  [0603]  (hidden comment: 1% 0603)
Cout721  value 47uF  [0603]  (hidden comment: 1% 0603)
Coutx710  value 22uF  [0603]  (hidden comment: 1% 0603)
Coutx720  value 22uF  [0603]  (hidden comment: 1% 0603)
Csnubber710  value 2.2nF  [CAPC1005X61N]  (hidden comment: 1% 0402)
Csnubber720  value 2.2nF  [CAPC1005X61N]  (hidden comment: 1% 0402)
Css710  value 15nF  [CAPC1005X61N]  (hidden comment: 1% 0402)
Css720  value 15nF  [CAPC1005X61N]  (hidden comment: 1% 0402)
Cvcc710  value 1uF  [0603]  (hidden comment: 1% 0603)
Cvcc720  value 1uF  [0603]  (hidden comment: 1% 0603)
F6b  SMD Fuse  [1206]
F6c  SMD Fuse  [1206]
L710  (no value)  [WE-HCC_807021]
L720  (no value)  [WE-HCC_807021]
Rcomp710  value 1k  [0603]  (hidden comment: 1% 0603)
Rcomp711  value 11.3k  [0603]  (hidden comment: 1% 0603)
Rcomp720  value 1k  [0603]  (hidden comment: 1% 0603)
Rcomp721  value 11.3k  [0603]  (hidden comment: 1% 0603)
Rfbb710  value 2.7k  [0603]  (hidden comment: 1% 0603)
Rfbb720  value 2.7k  [0603]  (hidden comment: 1% 0603)
Rfbt710  value 24.3k  [0603]  (hidden comment: 1% 0603)
Rfbt720  value 24.3k  [0603]  (hidden comment: 1% 0603)
Rkelvin710  value 0Ohm  [0603]  (hidden comment: 1% 0603)
Rkelvin720  value 0Ohm  [0603]  (hidden comment: 1% 0603)
Roscet710  value 1.21k  [0603]  (hidden comment: 1% 0603)
Roscet720  value 1.21k  [0603]  (hidden comment: 1% 0603)
Rpgood710  value 100k  [0603]  (hidden comment: 1% 0603)
Rpgood720  value 100k  [0603]  (hidden comment: 1% 0603)
Rramp710  value 1Ohm  [0603]  (hidden comment: 1% 0603)
Rramp720  value 1Ohm  [0603]  (hidden comment: 1% 0603)
Rsnubber710  value 1Ohm  [0603]  (hidden comment: 1% 0603)
Rsnubber720  value 1Ohm  [0603]  (hidden comment: 1% 0603)
U710  TPS56121DQPR  [DQP0022A]
U720  TPS56121DQPR  [DQP0022A]

### Ports
Battery (in, see 5V,_3V3,_6a,_Batt[1A], 5V,_3V3,_6a,_Batt[1B], 5V,_3V3,_6a,_Batt[2D], 6b,_6c[1A], Test_Sensor_Connectoren[2C]), Battery (in, see 5V,_3V3,_6a,_Batt[1A], 5V,_3V3,_6a,_Batt[1B], 5V,_3V3,_6a,_Batt[2D], 6b,_6c[1C], Test_Sensor_Connectoren[2C])

### Nets
+6b: F6b.2
+6c: F6c.2
GND: Cbyp710.2 Cbyp720.2 Cin710.2 Cin711.2 Cin712.2 Cin720.2 Cin721.2 Cin722.2 Cinx710.2 Cinx720.2 Cout710.2 Cout711.2 Cout720.2 Cout721.2 Coutx710.2 Coutx720.2 Csnubber710.1 Csnubber720.1 Css710.1 Css720.1 Cvcc710.2 Cvcc720.2 Rfbb710.1 Rfbb720.1 Roscet710.2 Roscet720.2 U710.3(GND) U710.5(GND) U710.23(GND) U720.3(GND) U720.5(GND) U720.23(GND)
Battery: Cin710.1 Cin711.1 Cin712.1 Cin720.1 Cin721.1 Cin722.1 Cinx710.1 Cinx720.1 Rkelvin710.2 Rkelvin720.2 U710.12(VIN) U710.13(VIN) U710.14(VIN) U710.15(VIN) U710.16(VIN) U710.17(VIN) U720.12(VIN) U720.13(VIN) U720.14(VIN) U720.15(VIN) U720.16(VIN) U720.17(VIN) ; port Battery
NetCboot710_1: Cboot710.1 L710.1 Rsnubber710.2 U710.6(SW) U710.7(SW) U710.8(SW) U710.9(SW) U710.10(SW) U710.11(SW)
NetCboot710_2: Cboot710.2 Rramp710.2
NetCboot720_1: Cboot720.1 L720.1 Rsnubber720.2 U720.6(SW) U720.7(SW) U720.8(SW) U720.9(SW) U720.10(SW) U720.11(SW)
NetCboot720_2: Cboot720.2 Rramp720.2
NetCbyp710_1: Cbyp710.1 Rpgood710.1 U710.19(BP)
NetCbyp720_1: Cbyp720.1 Rpgood720.1 U720.19(BP)
NetCcomp710_1: Ccomp710.1 Rcomp710.1
NetCcomp710_2: Ccomp710.2 Cout710.1 Cout711.1 Coutx710.1 F6b.1 L710.2 Rfbt710.2
NetCcomp711_1: Ccomp711.1 Ccomp712.1 U710.1(COMP)
NetCcomp711_2: Ccomp711.2 Rcomp711.1
NetCcomp712_2: Ccomp712.2 Rcomp710.2 Rcomp711.2 Rfbb710.2 Rfbt710.1 U710.2(FB)
NetCcomp720_1: Ccomp720.1 Rcomp720.1
NetCcomp720_2: Ccomp720.2 Cout720.1 Cout721.1 Coutx720.1 F6c.1 L720.2 Rfbt720.2
NetCcomp721_1: Ccomp721.1 Ccomp722.1 U720.1(COMP)
NetCcomp721_2: Ccomp721.2 Rcomp721.1
NetCcomp722_2: Ccomp722.2 Rcomp720.2 Rcomp721.2 Rfbb720.2 Rfbt720.1 U720.2(FB)
NetCsnubber710_2: Csnubber710.2 Rsnubber710.1
NetCsnubber720_2: Csnubber720.2 Rsnubber720.1
NetCss710_2: Css710.2 U710.21(EN_SS)
NetCss720_2: Css720.2 U720.21(EN_SS)
NetCvcc710_1: Cvcc710.1 Rkelvin710.1 U710.20(VDD)
NetCvcc720_1: Cvcc720.1 Rkelvin720.1 U720.20(VDD)
NetRoscet710_1: Roscet710.1 U710.18(ILIM)
NetRoscet720_1: Roscet720.1 U720.18(ILIM)
NetRpgood710_2: Rpgood710.2 U710.22(PGD)
NetRpgood720_2: Rpgood720.2 U720.22(PGD)
NetRramp710_1: Rramp710.1 U710.4(BOOT)
NetRramp720_1: Rramp720.1 U720.4(BOOT)

### Notes on the sheet
- 6b,_6c
- Alle Widerstände bei 6V 1% Genau

### Library data of the parts
Cboot710 Cboot720 Ccomp710-Ccomp712 Ccomp720-Ccomp722 Csnubber710 Csnubber720 Css710 Css720 = VJ0402D100KXCAP: Kondensator; Package: None; Price: None; MP: VJ0402D100KXCAP; Availability: Unavailable
Cbyp710 Cbyp720 Cin710-Cin712 Cin720-Cin722 Cinx710 Cinx720 Cout710 Cout711 Cout720 Cout721 Coutx710 Coutx720 Cvcc710 Cvcc720 = KO: Kondensator
F6b F6c = SICHERUNG: as F6a on sheet 5V,_3V3,_6a,_Batt
L710 L720 = 7443340220: as L700 on sheet 5V,_3V3,_6a,_Batt; Datasheet Link: https://www.we-online.com/components/products/download/3D_WE-HCC-8070_7443340xxx_3D+%28rev1%29.pdf; Height: 7.2mm; Manufacturer_Part_Number: 7443340220; Mouser Part Number: 710-7443340220; Mouser Price/Stock: https://www.mouser.co.uk/ProductDetail/Wurth-Elektronik/7443340220?qs=MVRUG6Lt7nGtb48EAN9JeA%3D%3D
Rcomp710 Rcomp711 Rcomp720 Rcomp721 Rfbb710 Rfbb720 Rfbt710 Rfbt720 Rkelvin710 Rkelvin720 Roscet710 Roscet720 Rpgood710 Rpgood720 Rramp710 Rramp720 Rsnubber710 Rsnubber720 = RES: Widerstand
U710 U720 = TPS56121DQPR: as U700 on sheet 5V,_3V3,_6a,_Batt; PartNumber: TPS56121DQPR; RefDes: RefDes; TYPE: TYPE; Manufacturer_Part_Number: TPS56121DQPR; Manufacturer_Name: Texas Instruments; Copyright: Copyright (C) 2018 Accelerated Designs. All rights reserved

## Sheet STM32.SchDoc
size A4; SheetNumber: 8; SheetTotal: 9
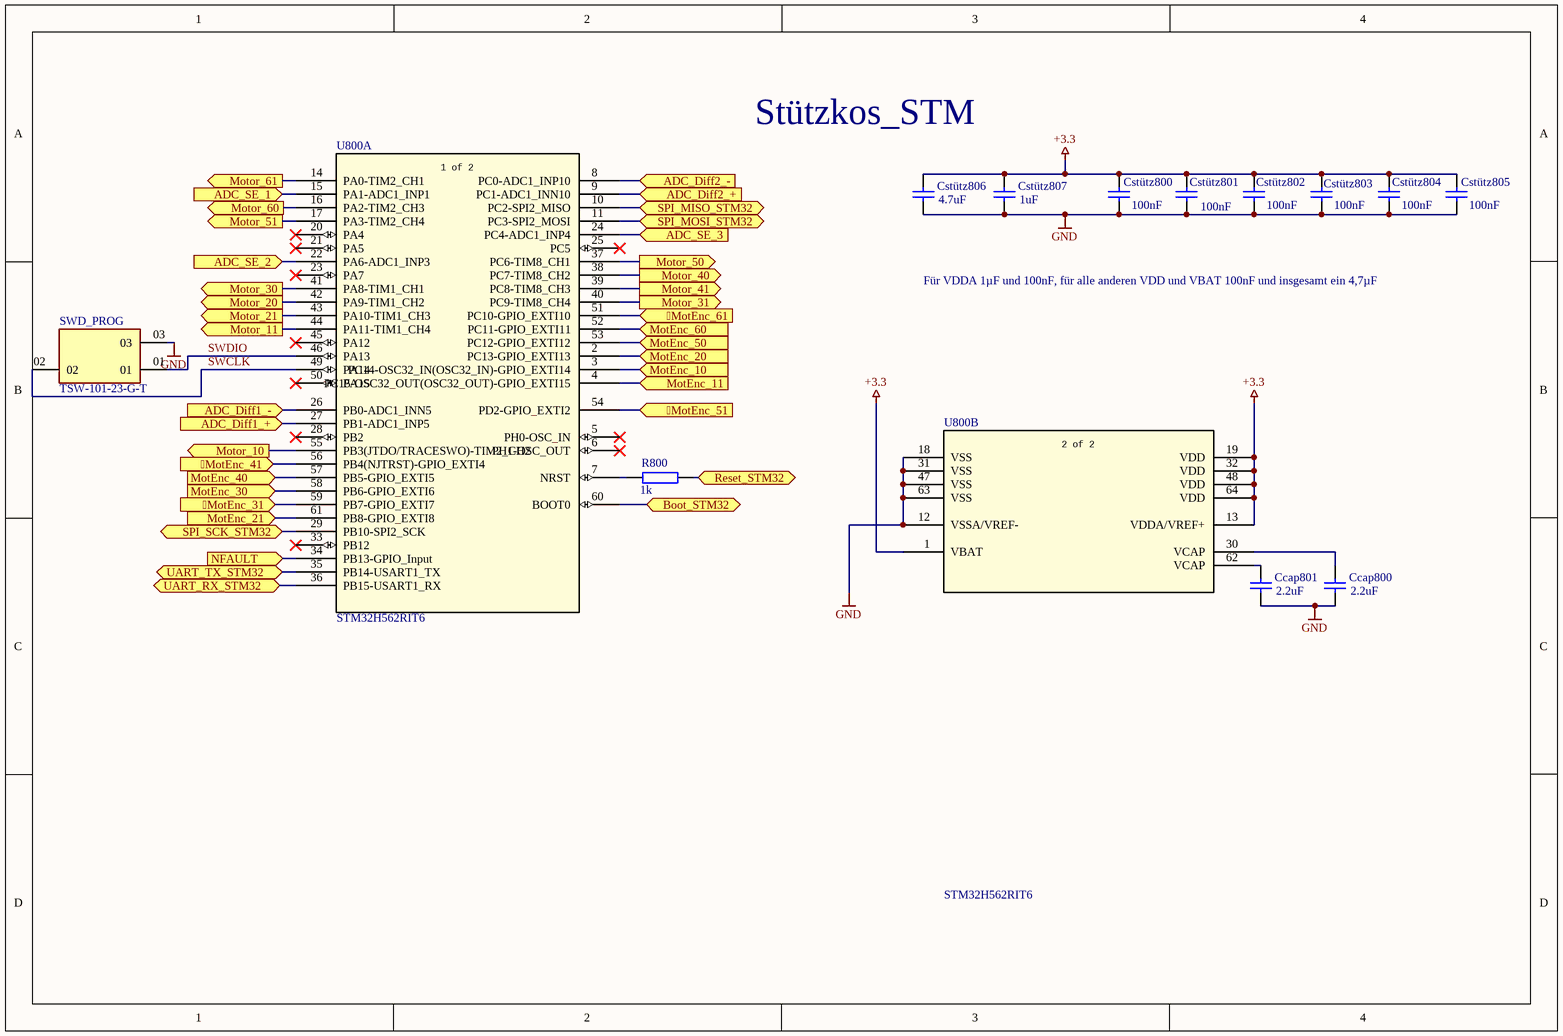
[diagram p7: STM32.SchDoc]

### Parts
Ccap800  value 2.2uF  [0603]  (hidden comment: 0603)
Ccap801  value 2.2uF  [0603]  (hidden comment: 0603)
Cstütz800  value 100nF  [0603]  (hidden comment: 0603)
Cstütz801  value 100nF  [0603]  (hidden comment: 0603)
Cstütz802  value 100nF  [0603]  (hidden comment: 0603)
Cstütz803  value 100nF  [0603]  (hidden comment: 0603)
Cstütz804  value 100nF  [0603]  (hidden comment: 0603)
Cstütz805  value 100nF  [0603]  (hidden comment: 0603)
Cstütz806  value 4.7uF  [0603]  (hidden comment: 0603)
Cstütz807  value 1uF  [0603]  (hidden comment: 0603)
R800  value 1k  [0603]  (hidden comment: 0603)
SWD_PROG  TSW-101-23-G-T  [SAMTEC_TSW-101-23-G-T]
U800  STM32H562RIT6  [LQFP64-10x10mm_STM]  (parts A,B of 2)

### Ports
MotEnc_31 (in, see DRV+Motor[3D]), MotEnc_41 (in, see DRV+Motor[3B]), MotEnc_51 (in, see DRV+Motor[3C]), MotEnc_61 (in, see DRV+Motor[3D]), ADC_Diff1_+ (in, see Test_Sensor_Connectoren[1A]), ADC_Diff1_- (in, see Test_Sensor_Connectoren[1A]), ADC_Diff2_+ (in, see Test_Sensor_Connectoren[1B]), ADC_Diff2_- (in, see Test_Sensor_Connectoren[1B]), ADC_SE_1 (in, see Test_Sensor_Connectoren[1C]), ADC_SE_2 (in, see Test_Sensor_Connectoren[1C]), ADC_SE_3 (in, see Test_Sensor_Connectoren[1D]), Boot_STM32 (bidir, see Raspberry_PI5[3B]), MotEnc_10 (in, see DRV+Motor[2B]), MotEnc_11 (in, see DRV+Motor[3B]), MotEnc_20 (in, see DRV+Motor[2C]), MotEnc_21 (in, see DRV+Motor[3C]), MotEnc_30 (in, see DRV+Motor[2D]), MotEnc_40 (in, see DRV+Motor[3B]), MotEnc_50 (in, see DRV+Motor[3C]), MotEnc_60 (in, see DRV+Motor[3D]), Motor_10 (out, see DRV+Motor[1A]), Motor_11 (out, see DRV+Motor[1A]), Motor_20 (out, see DRV+Motor[1A]), Motor_21 (out, see DRV+Motor[1A]), Motor_30 (out, see DRV+Motor[1B]), Motor_31 (out, see DRV+Motor[1B]), Motor_40 (out, see DRV+Motor[1C]), Motor_41 (out, see DRV+Motor[1C]), Motor_50 (out, see DRV+Motor[1D]), Motor_51 (out, see DRV+Motor[1D]), Motor_60 (out, see DRV+Motor[1D]), Motor_61 (out, see DRV+Motor[1D]), NFAULT (in, see DRV+Motor[2A], DRV+Motor[2B], DRV+Motor[2D], DRV+Motor[4A]), Reset_STM32 (bidir, see Raspberry_PI5[3B]), SPI_MISO_STM32 (bidir, see Raspberry_PI5[2B]), SPI_MOSI_STM32 (bidir, see Raspberry_PI5[2B]), SPI_SCK_STM32 (bidir, see Raspberry_PI5[2B]), UART_RX_STM32 (bidir, see Raspberry_PI5[3B]), UART_TX_STM32 (bidir, see Raspberry_PI5[3B])

### Nets
+3.3: Cstütz800.2 Cstütz801.2 Cstütz802.2 Cstütz803.2 Cstütz804.2 Cstütz805.2 Cstütz806.2 Cstütz807.2 U800.1(VBAT) U800.13(VDDA/VREF+) U800.19(VDD) U800.32(VDD) U800.48(VDD) U800.64(VDD)
GND: Ccap800.1 Ccap801.1 Cstütz800.1 Cstütz801.1 Cstütz802.1 Cstütz803.1 Cstütz804.1 Cstütz805.1 Cstütz806.1 Cstütz807.1 SWD_PROG.03 U800.12(VSSA/VREF-) U800.18(VSS) U800.31(VSS) U800.47(VSS) U800.63(VSS)
SWCLK: SWD_PROG.02 U800.49(PA14)
SWDIO: SWD_PROG.01 U800.46(PA13)
NetADC_Diff_1_2: U800.26(PB0-ADC1_INN5) ; port ADC_Diff1_-
NetADC_Diff_1_3: U800.27(PB1-ADC1_INP5) ; port ADC_Diff1_+
NetADC_Diff_2_2: U800.8(PC0-ADC1_INP10) ; port ADC_Diff2_-
NetADC_Diff_2_3: U800.9(PC1-ADC1_INN10) ; port ADC_Diff2_+
NetADC_Sens_1_2: U800.15(PA1-ADC1_INP1) ; port ADC_SE_1
NetADC_Sens_2_2: U800.22(PA6-ADC1_INP3) ; port ADC_SE_2
NetADC_Sens_3_2: U800.24(PC4-ADC1_INP4) ; port ADC_SE_3
NetCcap800_2: Ccap800.2 U800.30(VCAP)
NetCcap801_2: Ccap801.2 U800.62(VCAP)
NetR506_1: U800.34(PB13-GPIO_Input) ; port NFAULT
NetR507_2: U800.3(PC14-OSC32_IN(OSC32_IN)-GPIO_EXTI14) ; port MotEnc_10
NetR508_2: U800.4(PC15-OSC32_OUT(OSC32_OUT)-GPIO_EXTI15) ; port MotEnc_11
NetR509_2: U800.57(PB5-GPIO_EXTI5) ; port MotEnc_40
NetR510_2: U800.56(PB4(NJTRST)-GPIO_EXTI4) ; port MotEnc_41
NetR519_2: U800.2(PC13-GPIO_EXTI13) ; port MotEnc_20
NetR520_2: U800.61(PB8-GPIO_EXTI8) ; port MotEnc_21
NetR521_2: U800.53(PC12-GPIO_EXTI12) ; port MotEnc_50
NetR522_2: U800.54(PD2-GPIO_EXTI2) ; port MotEnc_51
NetR529_2: U800.58(PB6-GPIO_EXTI6) ; port MotEnc_30
NetR530_2: U800.59(PB7-GPIO_EXTI7) ; port MotEnc_31
NetR531_2: U800.52(PC11-GPIO_EXTI11) ; port MotEnc_60
NetR532_2: U800.51(PC10-GPIO_EXTI10) ; port MotEnc_61
NetR800_1: R800.1 ; port Reset_STM32
NetR800_2: R800.2 U800.7(NRST)
NetU100_8: U800.36(PB15-USART1_RX) ; port UART_RX_STM32
NetU100_10: U800.35(PB14-USART1_TX) ; port UART_TX_STM32
NetU100_19: U800.11(PC3-SPI2_MOSI) ; port SPI_MOSI_STM32
NetU100_21: U800.10(PC2-SPI2_MISO) ; port SPI_MISO_STM32
NetU100_23: U800.29(PB10-SPI2_SCK) ; port SPI_SCK_STM32
NetU100_35: U800.60(BOOT0) ; port Boot_STM32
NetU500_9: U800.42(PA9-TIM1_CH2) ; port Motor_20
NetU500_10: U800.43(PA10-TIM1_CH3) ; port Motor_21
NetU500_15: U800.44(PA11-TIM1_CH4) ; port Motor_11
NetU500_16: U800.55(PB3(JTDO/TRACESWO)-TIM2_CH2) ; port Motor_10
NetU501_9: U800.38(PC7-TIM8_CH2) ; port Motor_40
NetU501_10: U800.39(PC8-TIM8_CH3) ; port Motor_41
NetU501_15: U800.40(PC9-TIM8_CH4) ; port Motor_31
NetU501_16: U800.41(PA8-TIM1_CH1) ; port Motor_30
NetU502_9: U800.16(PA2-TIM2_CH3) ; port Motor_60
NetU502_10: U800.14(PA0-TIM2_CH1) ; port Motor_61
NetU502_15: U800.17(PA3-TIM2_CH4) ; port Motor_51
NetU502_16: U800.37(PC6-TIM8_CH1) ; port Motor_50

Not connected (* = marked no-connect by the designer): U800 5(PH0-OSC_IN)* 6(PH1-OSC_OUT)* 20(PA4)* 21(PA5)* 23(PA7)* 25(PC5)* 28(PB2)* 33(PB12)* 45(PA12)* 50(PA15)*

### Notes on the sheet
- Stützkos_STM
- Für VDDA 1µF und 100nF, für alle anderen VDD und VBAT 100nF und insgesamt ein 4,7µF
- (in symbol STM32H562RIT6, part A) 1 of 2
- (in symbol STM32H562RIT6, part B) 2 of 2

### Library data of the parts
Ccap800 Ccap801 Cstütz800-Cstütz807 = KO: Kondensator
R800 = RES: Widerstand
U800 = STM32H562RIT6: High-performance, Arm Cortex-M33 with TrustZone, MCU with 2-Mbyte Flash, 640-Kbyte RAM, 250 MHz CPU; Manufacturer_Name: STMicroelectronics; Copyright: Copyright (C) 2025 Ultra Librarian. All rights reserved.; Manufacturer_Part_Number: STM32H562RIT6; Datasheet: https://www.st.com/resource/en/datasheet/stm32h562ag.pdf; RefDes: RefDes; Type: Type
SWD_PROG = TSW-101-23-G-T: Package: None; Price: None; Value: *; MP: TSW-101-23-G-T; Availability: Unavailable

## Sheet Test_Sensor_Connectoren.SchDoc
size A4; SheetNumber: 9; SheetTotal: 9
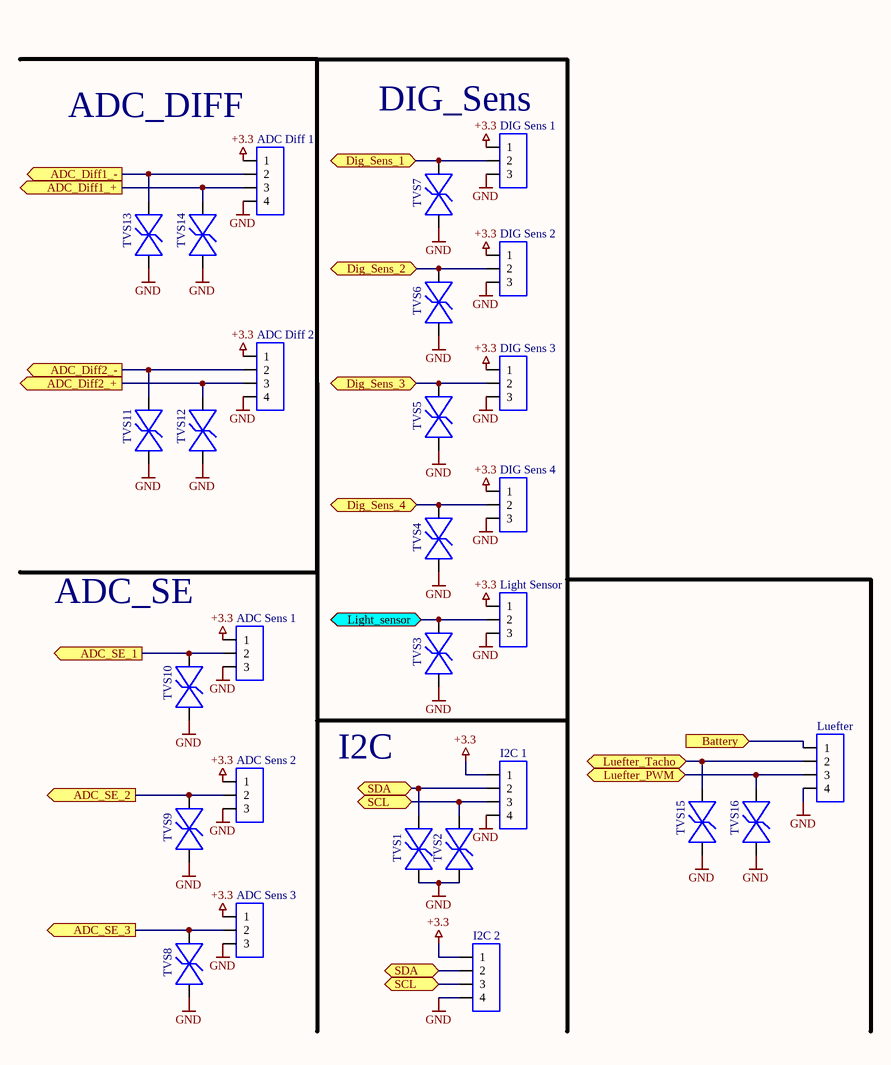
[diagram p8: Test_Sensor_Connectoren.SchDoc]

### Parts
ADC_Diff_1  JST-XH  [Sip-4]  (value not drawn)
ADC_Diff_2  JST-XH  [Sip-4]  (value not drawn)
ADC_Sens_1  JST-XH  [Sip-3]  (value not drawn)
ADC_Sens_2  JST-XH  [Sip-3]  (value not drawn)
ADC_Sens_3  JST-XH  [Sip-3]  (value not drawn)
DIG_Sens_1  JST-XH  [Sip-3]  (value not drawn)
DIG_Sens_2  JST-XH  [Sip-3]  (value not drawn)
DIG_Sens_3  JST-XH  [Sip-3]  (value not drawn)
DIG_Sens_4  JST-XH  [Sip-3]  (value not drawn)
I2C_1  JST-XH  [Sip-4]  (value not drawn)
I2C_2  JST-XH  [Sip-4]  (value not drawn)
Light_Sensor  JST-XH  [Sip-3]  (value not drawn)
Luefter  JST-XH  [Sip-4]  (value not drawn)
TVS1  DRTR5V0U1LPQ-7B  [X1-DFN1006-2_P6X1_DIO]  (value not drawn)
TVS2  DRTR5V0U1LPQ-7B  [X1-DFN1006-2_P6X1_DIO]  (value not drawn)
TVS3  DRTR5V0U1LPQ-7B  [X1-DFN1006-2_P6X1_DIO]  (value not drawn)
TVS4  DRTR5V0U1LPQ-7B  [X1-DFN1006-2_P6X1_DIO]  (value not drawn)
TVS5  DRTR5V0U1LPQ-7B  [X1-DFN1006-2_P6X1_DIO]  (value not drawn)
TVS6  DRTR5V0U1LPQ-7B  [X1-DFN1006-2_P6X1_DIO]  (value not drawn)
TVS7  DRTR5V0U1LPQ-7B  [X1-DFN1006-2_P6X1_DIO]  (value not drawn)
TVS8  DRTR5V0U1LPQ-7B  [X1-DFN1006-2_P6X1_DIO]  (value not drawn)
TVS9  DRTR5V0U1LPQ-7B  [X1-DFN1006-2_P6X1_DIO]  (value not drawn)
TVS10  DRTR5V0U1LPQ-7B  [X1-DFN1006-2_P6X1_DIO]  (value not drawn)
TVS11  DRTR5V0U1LPQ-7B  [X1-DFN1006-2_P6X1_DIO]  (value not drawn)
TVS12  DRTR5V0U1LPQ-7B  [X1-DFN1006-2_P6X1_DIO]  (value not drawn)
TVS13  DRTR5V0U1LPQ-7B  [X1-DFN1006-2_P6X1_DIO]  (value not drawn)
TVS14  DRTR5V0U1LPQ-7B  [X1-DFN1006-2_P6X1_DIO]  (value not drawn)
TVS15  DRTR5V0U1LPQ-7B  [X1-DFN1006-2_P6X1_DIO]  (value not drawn)
TVS16  DRTR5V0U1LPQ-7B  [X1-DFN1006-2_P6X1_DIO]  (value not drawn)

### Ports
ADC_Diff1_+ (out, see STM32[1C]), ADC_Diff1_- (out, see STM32[1C]), ADC_Diff2_+ (out, see STM32[2B]), ADC_Diff2_- (out, see STM32[2B]), ADC_SE_1 (out, see STM32[1B]), ADC_SE_2 (out, see STM32[1B]), ADC_SE_3 (out, see STM32[2B]), Battery (in, see 5V,_3V3,_6a,_Batt[1A], 5V,_3V3,_6a,_Batt[1B], 5V,_3V3,_6a,_Batt[2D], 6b,_6c[1A], 6b,_6c[1C]), Dig_Sens_1 (bidir, see Raspberry_PI5[2B]), Dig_Sens_2 (bidir, see Raspberry_PI5[2B]), Dig_Sens_3 (bidir, see Raspberry_PI5[2B]), Dig_Sens_4 (bidir, see Raspberry_PI5[2B]), Light_sensor (bidir, see Raspberry_PI5[3B]), Luefter_PWM (bidir, see Raspberry_PI5[3B]), Luefter_Tacho (bidir, see Raspberry_PI5[3B]), SCL (bidir, see BNO555[2C], ICM-20948[2C], PCA9685[2B], Raspberry_PI5[2B], Test_Sensor_Connectoren[1D]), SCL (bidir, see BNO555[2C], ICM-20948[2C], PCA9685[2B], Raspberry_PI5[2B], Test_Sensor_Connectoren[2D]), SDA (bidir, see BNO555[2C], ICM-20948[2B], PCA9685[2B], Raspberry_PI5[2B], Test_Sensor_Connectoren[1C]), SDA (bidir, see BNO555[2C], ICM-20948[2B], PCA9685[2B], Raspberry_PI5[2B], Test_Sensor_Connectoren[2D])

### Nets
+3.3: ADC_Diff_1.1 ADC_Diff_2.1 ADC_Sens_1.1 ADC_Sens_2.1 ADC_Sens_3.1 DIG_Sens_1.1 DIG_Sens_2.1 DIG_Sens_3.1 DIG_Sens_4.1 I2C_1.1 I2C_2.1 Light_Sensor.1
GND: ADC_Diff_1.4 ADC_Diff_2.4 ADC_Sens_1.3 ADC_Sens_2.3 ADC_Sens_3.3 DIG_Sens_1.3 DIG_Sens_2.3 DIG_Sens_3.3 DIG_Sens_4.3 I2C_1.4 I2C_2.4 Light_Sensor.3 Luefter.4 TVS1.1 TVS2.1 TVS3.1 TVS4.1 TVS5.1 TVS6.1 TVS7.1 TVS8.1 TVS9.1 TVS10.1 TVS11.1 TVS12.1 TVS13.1 TVS14.1 TVS15.1 TVS16.1
Battery: Luefter.1 ; port Battery
SCL: I2C_1.3 I2C_2.3 TVS2.2 ; port SCL
SDA: I2C_1.2 I2C_2.2 TVS1.2 ; port SDA
NetADC_Diff_1_2: ADC_Diff_1.2 TVS13.2 ; port ADC_Diff1_-
NetADC_Diff_1_3: ADC_Diff_1.3 TVS14.2 ; port ADC_Diff1_+
NetADC_Diff_2_2: ADC_Diff_2.2 TVS11.2 ; port ADC_Diff2_-
NetADC_Diff_2_3: ADC_Diff_2.3 TVS12.2 ; port ADC_Diff2_+
NetADC_Sens_1_2: ADC_Sens_1.2 TVS10.2 ; port ADC_SE_1
NetADC_Sens_2_2: ADC_Sens_2.2 TVS9.2 ; port ADC_SE_2
NetADC_Sens_3_2: ADC_Sens_3.2 TVS8.2 ; port ADC_SE_3
NetDIG_Sens_1_2: DIG_Sens_1.2 TVS7.2 ; port Dig_Sens_1
NetDIG_Sens_2_2: DIG_Sens_2.2 TVS6.2 ; port Dig_Sens_2
NetDIG_Sens_3_2: DIG_Sens_3.2 TVS5.2 ; port Dig_Sens_3
NetDIG_Sens_4_2: DIG_Sens_4.2 TVS4.2 ; port Dig_Sens_4
NetLight_Sensor_2: Light_Sensor.2 TVS3.2 ; port Light_sensor
NetLuefter_2: Luefter.2 TVS15.2 ; port Luefter_Tacho
NetLuefter_3: Luefter.3 TVS16.2 ; port Luefter_PWM

### Notes on the sheet
- ADC_DIFF
- (near DIG_Sens_1) DIG_Sens
- ADC_SE
- I2C

### Library data of the parts
ADC_Diff_1 ADC_Diff_2 I2C_1 I2C_2 Luefter = CON4
ADC_Sens_1-ADC_Sens_3 DIG_Sens_1-DIG_Sens_4 Light_Sensor = CON3
TVS1-TVS16 = DRTR5V0U1LPQ-7B: TVS Diode; Manufacturer_Name: Diodes Inc; Copyright: Copyright (C) 2025 Ultra Librarian. All rights reserved.; Manufacturer_Part_Number: DRTR5V0U1LPQ-7B; RefDes: RefDes; Type: Type

## Nets that join several sheets
+3.3: BNO085 (7 pins), LSM6DSO (5 pins), PCA9685 (C400.2 C401.2 PCA/0x40.28), DRV+Motor (R506.2), 5V,_3V3,_6a,_Batt (C601.2 U601.5), STM32 (14 pins), Test_Sensor_Connectoren (12 pins)
+5: Raspberry_PI5 (C100.1 C101.2 U100.2 U100.4), DRV+Motor (6 pins), 5V,_3V3,_6a,_Batt (C600.2 F5.2 U601.1 U601.3)
+6a: PCA9685 (8 pins), 5V,_3V3,_6a,_Batt (F6a.2)
+6b: PCA9685 (8 pins), 6b,_6c (F6b.2)
+6c: DRV+Motor (12 pins), 6b,_6c (F6c.2)
GND: Raspberry_PI5 (13 pins), BNO085 (8 pins), LSM6DSO (7 pins), PCA9685 (27 pins), DRV+Motor (42 pins), 5V,_3V3,_6a,_Batt (32 pins), 6b,_6c (32 pins), STM32 (16 pins), Test_Sensor_Connectoren (29 pins)
Battery: 5V,_3V3,_6a,_Batt (18 pins), 6b,_6c (22 pins), Test_Sensor_Connectoren (Luefter.1)
NetADC_Diff_1_2: STM32 (U800.26), Test_Sensor_Connectoren (ADC_Diff_1.2 TVS13.2)
NetADC_Diff_1_3: STM32 (U800.27), Test_Sensor_Connectoren (ADC_Diff_1.3 TVS14.2)
NetADC_Diff_2_2: STM32 (U800.8), Test_Sensor_Connectoren (ADC_Diff_2.2 TVS11.2)
NetADC_Diff_2_3: STM32 (U800.9), Test_Sensor_Connectoren (ADC_Diff_2.3 TVS12.2)
NetADC_Sens_1_2: STM32 (U800.15), Test_Sensor_Connectoren (ADC_Sens_1.2 TVS10.2)
NetADC_Sens_2_2: STM32 (U800.22), Test_Sensor_Connectoren (ADC_Sens_2.2 TVS9.2)
NetADC_Sens_3_2: STM32 (U800.24), Test_Sensor_Connectoren (ADC_Sens_3.2 TVS8.2)
NetDIG_Sens_1_2: Raspberry_PI5 (U100.11), Test_Sensor_Connectoren (DIG_Sens_1.2 TVS7.2)
NetDIG_Sens_2_2: Raspberry_PI5 (U100.13), Test_Sensor_Connectoren (DIG_Sens_2.2 TVS6.2)
NetDIG_Sens_3_2: Raspberry_PI5 (U100.12), Test_Sensor_Connectoren (DIG_Sens_3.2 TVS5.2)
NetDIG_Sens_4_2: Raspberry_PI5 (U100.15), Test_Sensor_Connectoren (DIG_Sens_4.2 TVS4.2)
NetLight_Sensor_2: Raspberry_PI5 (U100.33), Test_Sensor_Connectoren (Light_Sensor.2 TVS3.2)
NetLuefter_2: Raspberry_PI5 (U100.38), Test_Sensor_Connectoren (Luefter.2 TVS15.2)
NetLuefter_3: Raspberry_PI5 (U100.40), Test_Sensor_Connectoren (Luefter.3 TVS16.2)
NetR506_1: DRV+Motor (R506.1 U500.8 U501.8 U502.8), STM32 (U800.34)
NetR507_2: DRV+Motor (R507.2 R511.2), STM32 (U800.3)
NetR508_2: DRV+Motor (R508.2 R512.2), STM32 (U800.4)
NetR509_2: DRV+Motor (R509.2 R513.2), STM32 (U800.57)
NetR510_2: DRV+Motor (R510.2 R514.2), STM32 (U800.56)
NetR519_2: DRV+Motor (R519.2 R523.2), STM32 (U800.2)
NetR520_2: DRV+Motor (R520.2 R524.2), STM32 (U800.61)
NetR521_2: DRV+Motor (R521.2 R525.2), STM32 (U800.53)
NetR522_2: DRV+Motor (R522.2 R526.2), STM32 (U800.54)
NetR529_2: DRV+Motor (R529.2 R535.2), STM32 (U800.58)
NetR530_2: DRV+Motor (R530.2 R536.2), STM32 (U800.59)
NetR531_2: DRV+Motor (R531.2 R537.2), STM32 (U800.52)
NetR532_2: DRV+Motor (R532.2 R538.2), STM32 (U800.51)
NetR800_1: Raspberry_PI5 (U100.36), STM32 (R800.1)
NetU100_8: Raspberry_PI5 (U100.8), STM32 (U800.36)
NetU100_10: Raspberry_PI5 (U100.10), STM32 (U800.35)
NetU100_19: Raspberry_PI5 (U100.19), STM32 (U800.11)
NetU100_21: Raspberry_PI5 (U100.21), STM32 (U800.10)
NetU100_23: Raspberry_PI5 (U100.23), STM32 (U800.29)
NetU100_29: Raspberry_PI5 (U100.29), BNO085 (U200.14)
NetU100_31: Raspberry_PI5 (U100.31), BNO085 (U200.11)
NetU100_32: Raspberry_PI5 (U100.32), LSM6DSO (U300.4)
NetU100_35: Raspberry_PI5 (U100.35), STM32 (U800.60)
NetU500_9: DRV+Motor (U500.9), STM32 (U800.42)
NetU500_10: DRV+Motor (U500.10), STM32 (U800.43)
NetU500_15: DRV+Motor (U500.15), STM32 (U800.44)
NetU500_16: DRV+Motor (U500.16), STM32 (U800.55)
NetU501_9: DRV+Motor (U501.9), STM32 (U800.38)
NetU501_10: DRV+Motor (U501.10), STM32 (U800.39)
NetU501_15: DRV+Motor (U501.15), STM32 (U800.40)
NetU501_16: DRV+Motor (U501.16), STM32 (U800.41)
NetU502_9: DRV+Motor (U502.9), STM32 (U800.16)
NetU502_10: DRV+Motor (U502.10), STM32 (U800.14)
NetU502_15: DRV+Motor (U502.15), STM32 (U800.17)
NetU502_16: DRV+Motor (U502.16), STM32 (U800.37)
SCL: Raspberry_PI5 (U100.5), BNO085 (U200.19), LSM6DSO (U300.13), PCA9685 (PCA/0x40.26), Test_Sensor_Connectoren (I2C_1.3 I2C_2.3 TVS2.2)
SDA: Raspberry_PI5 (U100.3), BNO085 (U200.20), LSM6DSO (U300.14), PCA9685 (PCA/0x40.27), Test_Sensor_Connectoren (I2C_1.2 I2C_2.2 TVS1.2)